# EAGLE board MeshPoint.One (EAGLE 9.1.3), part 1 of 2
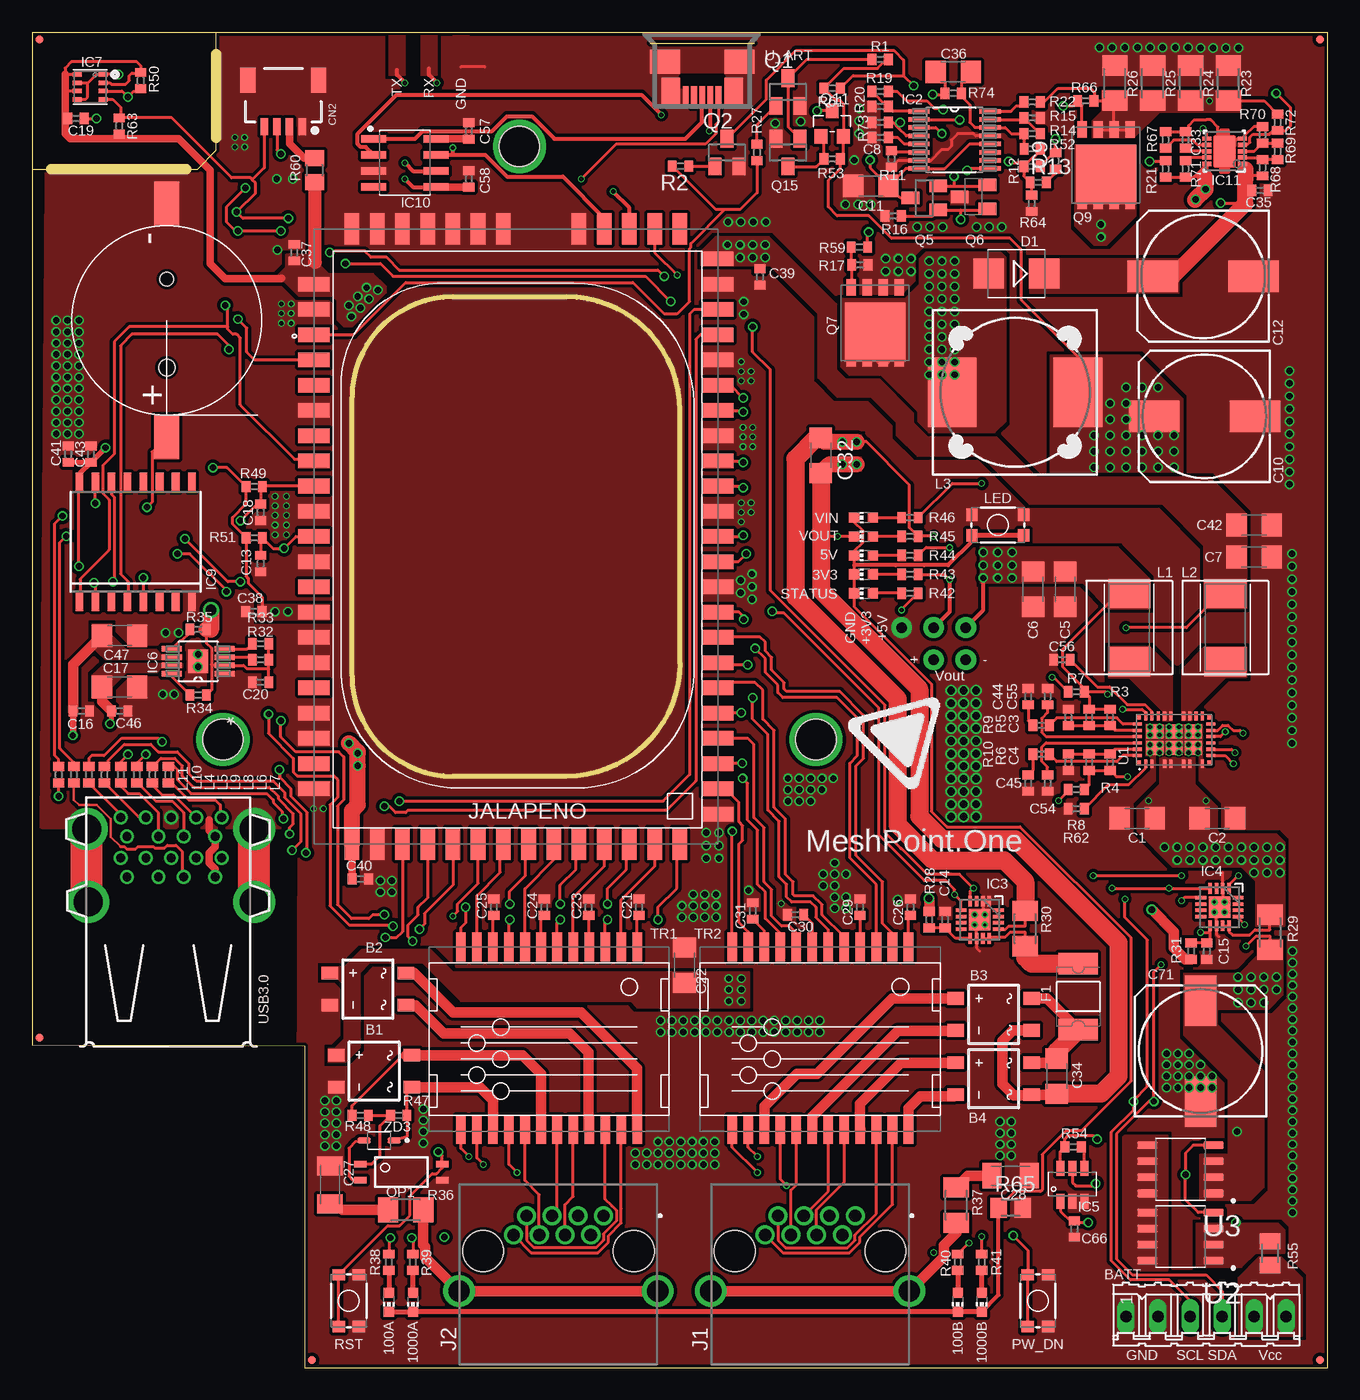
[diagram p10: board, top side]
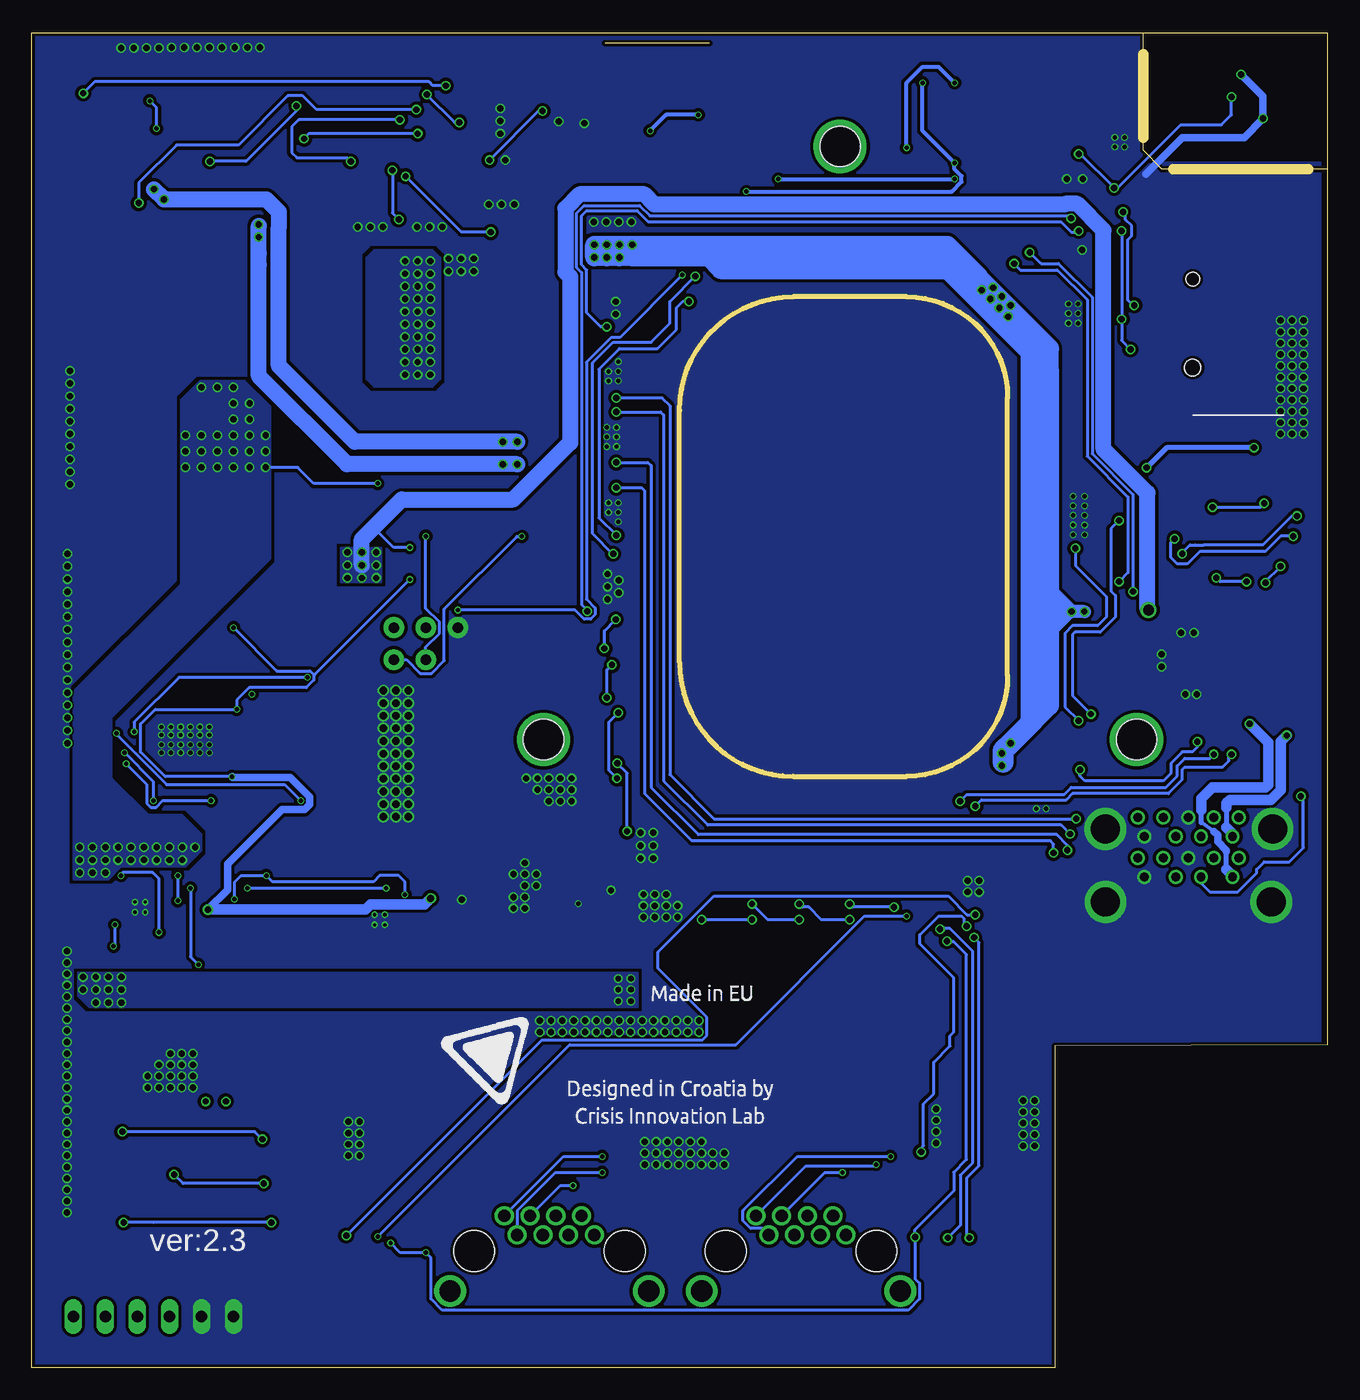
[diagram p11: board, bottom side, seen from below]

Size 102.7 x 105.8 mm. Coordinates in mm from the lower left corner, seen from the top.
Outline: 14.6,105.8 102.7,105.8 102.7,0 21.6,0 21.6,25.5 0,25.6 0,95
Outline: 14.6,105.8 0,105.8 0,95
Outline: 0,95 13.1,95 14.6,96.5 14.6,105.8
Copper layers (1*16): Top 0.035mm / dielectric 1.5mm / Bottom 0.035mm
Design rules "jlcpcb": minimum track width 3.5mil, minimum drill 0.2mm, track to track 5mil, track to pad 5mil, pad to pad 5mil, via to via 5mil, smd to smd 5mil, copper to edge 0.2mm, drill to drill 0.4mm, minimum pad ring 3mil, minimum via ring 3mil, stop-mask expansion 4mil, vias tented up to drill 35mil, thermal gap 10mil
Milling: 2 lines

## Footprints (pad centres in the part's own frame; a part is rotated, then mirrored left to right if it is on the bottom)
CHIP-LED0603 = smd 0.8 x 0.8: A 0,-0.75; C 0,0.75
MBS = smd 1 x 1.3: + -1.27,-3; - 1.27,-3; AC1 -1.27,3; AC2 1.27,3
06P = drill 0.914 long: 1 -6.35,0; 2 -3.81,0; 3 -1.27,0; 4 1.27,0; 5 3.81,0; 6 6.35,0
BATERIJA12MM = smd 3.5 x 2 bottom: + 9.25,0; - -9.25,0 | hole 1.1: -3.276,0 | hole 1.3: 3.744,0
C1206 = smd 1.6 x 1.8: 1 -1.4,0; 2 1.4,0
C0402 = smd 0.7 x 0.9: 1 -0.65,0; 2 0.65,0
153CLV-1010 = smd 4 x 2.5: + 4,0; - -4,0
C1206K = smd 1.5 x 2: 1 -1.5,0; 2 1.5,0
EASYC = smd 0.6 x 1.35: 1 -1.5,2.54; 2 -0.5,2.54; 3 0.5,2.54; 4 1.5,2.54 | smd 1.2 x 2: NC1 2.8,-1.135; NC2 -2.8,-1.135
SMB = smd 2.4 x 2.4: A 2.2,0; C -2.2,0
PTC1812L = smd 1.7 x 3.15: 1 -2.62,0; 2 2.62,0
FIDUCIAL-MICRO = smd 0.635 x 0.635: 1 0,0
PW16 = smd 1.676 x 0.356: 1 -2.819,2.275; 2 -2.819,1.625; 3 -2.819,0.975; 4 -2.819,0.325; 5 -2.819,-0.325; 6 -2.819,-0.975; 7 -2.819,-1.625; 8 -2.819,-2.275; 9 2.819,-2.275; 10 2.819,-1.625; 11 2.819,-0.975; 12 2.819,-0.325; 13 2.819,0.325; 14 2.819,0.975; 15 2.819,1.625; 16 2.819,2.275
RGT16_1P7X1P7 = smd 0.85 x 0.28: 1 -1.475,0.75; 2 -1.475,0.25; 3 -1.475,-0.25; 4 -1.475,-0.75; 9 1.475,-0.75; 10 1.475,-0.25; 11 1.475,0.25; 12 1.475,0.75 | smd 0.28 x 0.85: 5 -0.75,-1.475; 6 -0.25,-1.475; 7 0.25,-1.475; 8 0.75,-1.475; 13 0.75,1.475; 14 0.25,1.475; 15 -0.25,1.475; 16 -0.75,1.475 | smd 1.7 x 1.7: 17 0,0 | drill 0.254 pad 0.508: GND -0.406,0.406; V -0.406,-0.406; V_2 0.406,-0.406; V_3 0.406,0.406
TSOT23 = smd 0.62 x 1.22: 1 -0.9,-1.32; 2 0.05,-1.32; 3 1,-1.32; 4 1,1.3; 5 0.05,1.3; 6 -0.9,1.3
DGN8_1P89X1P57 = smd 1.575 x 0.432: 1 -2.095,0.975; 2 -2.095,0.325; 3 -2.095,-0.325; 4 -2.095,-0.975; 5 2.095,-0.975; 6 2.095,-0.325; 7 2.095,0.325; 8 2.095,0.975 | smd 1.57 x 1.89: EPAD 0,0
BME280 = smd 0.7 x 0.35: 1 1.025,0.975; 2 1.025,0.325; 3 1.025,-0.325; 4 1.025,-0.975; 5 -1.025,-0.975; 6 -1.025,-0.325; 7 -1.025,0.325; 8 -1.025,0.975
SO16DF = smd 0.6 x 1.5: 1 -4.145,-5.09; 2 -2.875,-5.09; 3 -1.605,-5.09; 4 -0.335,-5.09; 5 0.935,-5.09; 6 2.205,-5.09; 7 3.475,-5.09; 8 4.745,-5.09; 9 4.745,4.39; 10 3.475,4.39; 11 2.205,4.39; 12 0.935,4.39; 13 -0.335,4.39; 14 -1.605,4.39; 15 -2.875,4.39; 16 -4.145,4.39
SOIC127P600X175-8 = smd 1.968 x 0.599: 1 -2.473,1.905; 2 -2.473,0.635; 3 -2.473,-0.635; 4 -2.473,-1.905; 5 2.473,-1.905; 6 2.473,-0.635; 7 2.473,0.635; 8 2.473,1.905
DRC0010J = smd 0.7 x 0.35: 1 -1.4,1; 2 -1.4,0.5; 3 -1.4,0; 4 -1.4,-0.5; 5 -1.4,-1; 6 1.4,-1; 7 1.4,-0.5; 8 1.4,0; 9 1.4,0.5; 10 1.4,1 | smd 1.65 x 2.4: 11 0,0 | smd 0.5 x 0.5: V 0,-0.95
SS60300079 = drill 0.97 pad 1.509: 1 0,0; 2 1.02,1.52; 3 -1.02,1.52; 4 -3.06,1.52; 5 -2.04,0; 6 -4.08,0; 7 -6.12,0; 8 -5.1,1.52 | drill 1.68 pad 2.52: MH1 -10.43,-4.45; MH2 5.31,-4.45 | hole 3.25: -8.53,-1.27; 3.41,-1.27
INDC6932X320 = smd 2.312 x 3.312: 1 -2.7,0; 2 2.7,0
DR125 = smd 3.85 x 5.5: 1 -4.975,0; 2 4.975,0
R0402 = smd 0.7 x 0.9: 1 -0.65,0; 2 0.65,0
TACTILE_SWITCH_SMD_4.6X2.8MM = smd 0.9 x 1: 1 -2.05,-0.8; 2 2.05,-0.8; 3 2.05,0.8; 4 -2.05,0.8
MINI-FLAT-4 = smd 1 x 0.5: 1 -3.24,0.635; 2 -3.24,-0.635; 3 3.24,-0.635; 4 3.24,0.635
SOT23 = smd 1 x 1.4: 1 -0.95,-1.1; 2 0.95,-1.1; 3 0,1.1
SOT23-BEC = smd 1 x 1.4: B -0.95,-1.1; C 0,1.1; E 0.95,-1.1
PG-TDSON-8 = smd 1.3 x 0.75: 1 -2.825,1.905; 2 -2.825,0.635; 3 -2.825,-0.635; 4 -2.825,-1.905; 5 2.825,-1.905; 6 2.825,-0.635; 7 2.825,0.635; 8 2.825,1.905 | smd 4.7 x 4.8: TH 0.725,0
SOT-23:1 = smd 1.016 x 1.143: 1 -0.889,-1.016; 2 0.889,-1.016; 3 0,1.016
M1206 = smd 1.6 x 2: 1 -1.4,0; 2 1.4,0
M0805 = smd 1.3 x 1.6: 1 -0.95,0; 2 0.95,0
R0805 = smd 1.3 x 1.5: 1 -0.95,0; 2 0.95,0
WURTH1000T = smd 0.76 x 2.29: 1 -6.35,-6.35; 2 -5.08,-6.35; 3 -3.81,-6.35; 4 -2.54,-6.35; 5 -1.27,-6.35; 6 0,-6.35; 7 1.27,-6.35; 8 2.54,-6.35; 9 3.81,-6.35; 10 5.08,-6.35; 11 6.35,-6.35; 12 7.62,-6.35; 13 7.62,8.13; 14 6.35,8.13; 15 5.08,8.13; 16 3.81,8.13; 17 2.54,8.13; 18 1.27,8.13; 19 0,8.13; 20 -1.27,8.13; 21 -2.54,8.13; 22 -3.81,8.13; 23 -5.08,8.13; 24 -6.35,8.13
QFN50P600X400X103-32N240X440 = smd 0.7 x 0.25: 1 -1.9,2.25; 2 -1.9,1.75; 4 -1.9,0.75; 5 -1.9,0.25; 7 -1.9,-0.75; 8 -1.9,-1.25; 10 -1.9,-2.25; 17 1.9,-2.25; 18 1.9,-1.75; 19 1.9,-1.25; 20 1.9,-0.75; 22 1.9,0.25; 23 1.9,0.75; 24 1.9,1.25; 25 1.9,1.75; 26 1.9,2.25 | smd 0.25 x 0.7: 11 -1.25,-2.9; 12 -0.75,-2.9; 13 -0.25,-2.9; 14 0.25,-2.9; 15 0.75,-2.9; 16 1.25,-2.9; 27 1.25,2.9; 28 0.75,2.9; 29 0.25,2.9; 30 -0.25,2.9; 31 -0.75,2.9; 32 -1.25,2.9 | smd 1.1 x 1.33: 33 -0.65,1.53; 34 0.65,1.53; 35 -0.65,0; 36 0.65,0; 37 -0.65,-1.53; 38 0.65,-1.53 | smd 0.375 x 0.375: P1 -1.812,2.812; P2 1.812,2.812; P3 -1.812,-2.812; P4 1.812,-2.812
SOIC127P490X600X175-8N = smd 1.58 x 0.59: 1 -2.625,1.905; 2 -2.625,0.635; 3 -2.625,-0.635; 4 -2.625,-1.905; 5 2.625,-1.905; 6 2.625,-0.635; 7 2.625,0.635; 8 2.625,1.905
JALAPENO-PCB = smd 1.15 x 2.5: 1 -21.13,-15.24; 2 -19.13,-15.24; 3 -17.13,-15.24; 4 -15.13,-15.24; 5 -13.13,-15.24; 6 -11.13,-15.24; 7 -9.13,-15.24; 8 -7.13,-15.24; 9 -5.13,-15.24; 10 -3.13,-15.24; 11 -1.13,-15.24; 12 0.87,-15.24; 13 2.87,-15.24; 14 4.87,-15.24; 15 6.87,-15.24; 16 8.87,-15.24; 17 10.87,-15.24; 18 12.87,-15.24; 19 14.87,-15.24; 20 16.87,-15.24; 21 18.87,-15.24; 22 20.87,-15.24; 23 22.87,-15.24; 36 20.87,16.76; 37 18.87,16.76; 38 16.87,16.76; 39 14.87,16.76; 40 12.87,16.76; 41 10.87,16.76; 42 8.87,16.76; 43 6.87,16.76; 44 4.87,16.76; 45 2.87,16.76; 46 0.87,16.76; 47 -1.13,16.76; 48 -3.13,16.76; 49 -5.13,16.76; 50 -7.13,16.76; 51 -9.13,16.76; 52 -11.13,16.76; 53 -13.13,16.76; 54 -15.13,16.76; 55 -17.13,16.76; 56 -19.13,16.76 | smd 2.5 x 1.15: 24 25.235,-12.24; 25 25.235,-10.24; 26 25.235,-8.24; 27 25.235,-6.24; 28 25.235,-4.24; 29 25.235,1.76; 30 25.235,3.76; 31 25.235,5.76; 32 25.235,7.76; 33 25.235,9.76; 34 25.235,11.76; 35 25.235,13.76; 57 -23.495,13.76; 58 -23.495,11.76; 59 -23.495,9.76; 60 -23.495,7.76; 61 -23.495,5.76; 62 -23.495,3.76; 63 -23.495,1.76; 64 -23.495,-0.24; 65 -23.495,-2.24; 66 -23.495,-4.24; 67 -23.495,-6.24; 68 -23.495,-8.24; 69 -23.495,-10.24; 70 -23.495,-12.24
HEATSINK = drill 3.2: 1 -23.98,-22.52; 2 23.02,-22.52; 3 -0.48,24.48 | hole 3.2: -0.48,24.48; -23.98,-22.52; 23.02,-22.52
MOLEX-47364-0001 = smd 1.7 x 0.45: 1 2.8,1.3; 2 2.8,0.65; 3 2.8,0; 4 2.8,-0.65; 5 2.8,-1.3 | smd 1.9 x 2.375: GND1 0,2.95; GND4 0,-2.95 | smd 2.1 x 1.475: GND2 2.3,2.5; GND3 2.3,-2.5
USB3.0D = drill 0.7 pad 1.1: 1 -3.59,1.7; 2 -1.09,1.7; 3 0.91,1.7; 4 3.41,1.7; 5 3.91,3.2; 6 1.91,3.2; 7 -0.09,3.2; 8 -2.09,3.2; 9 -4.09,3.2; 10 -3.59,4.9; 11 -1.09,4.9; 12 0.91,4.9; 13 3.41,4.9; 14 3.91,6.4; 15 1.91,6.4; 16 -0.09,6.4; 17 -2.09,6.4; 18 -4.09,6.4 | drill 2.3 pad 2.7: PAD1 -6.66,-0.3; PAD2 6.48,-0.3; PAD3 -6.76,5.5; PAD4 6.49,5.5
SOD2513X120N = smd 1.04 x 0.46: A 1.19,0; C -1.19,0

## Placement (x,y rotation side)
3V3  GR  [CHIP-LED0603]  65.9,62.88 90 top
5V  GR  [CHIP-LED0603]  65.9,64.38 90 top
100A  YL  [CHIP-LED0603]  28.27,5.18 180 top
100B  YL  [CHIP-LED0603]  73.35,5.18 180 top
1000A  GR  [CHIP-LED0603]  30.18,5.18 180 top
1000B  GR  [CHIP-LED0603]  75.26,5.18 180 top
B1  1A/50V  [MBS]  27.1,23.5 270 top
B2  1A/50V  [MBS]  26.6,30 270 top
B3  1A/50V  [MBS]  76.2,28 270 top
B4  1A/50V  [MBS]  76.2,22.9 270 top
BATT  Batt conector  [06P]  93.04,4.04 0 top
BATT1  BATTCR1220  [BATERIJA12MM]  10.67,83 270 bottom
C1  4.7uF  [C1206]  87.58,43.54 0 top
C2  4.7uF  [C1206]  93.93,43.54 0 top
C3  4.7pF  [C0402]  83.77,51.54 90 top
C4  4.7pF  [C0402]  83.77,47.98 90 top
C5  47uF  [C1206]  81.86,61.7 270 top
C6  47uF  [C1206]  79.32,61.7 270 top
C7  47uF  [C1206]  96.85,64.24 180 top
C8  10n/35V  [C0402]  67.2,97.5 180 top
C9  10n/35V  [C0402]  81.1,95.63 90 top
C10  220u/35V  [153CLV-1010]  92.9,75.4 180 top
C11  10u/35V  [C1206]  66.47,93.65 0 top
C12  220u/35V  [153CLV-1010]  92.8,86.5 180 top
C13  100p/35V  [C0402]  18.11,63.73 90 top
C14  1u/35V  [C0402]  72.35,35.5 90 top
C15  1u/35V  [C0402]  93.1,33 270 top
C16  100n/35V  [C0402]  3.89,52.05 0 top
C17  10u/35V  [C1206]  6.93,53.95 180 top
C18  100p/35V  [C0402]  18.11,67.79 270 top
C19  100n/35V  [C0402]  3.47,99 0 top
C20  100n/35V  [C0402]  18.11,54.33 0 top
C21  100n/35V  [C0402]  48.1,36.5 270 top
C22  10u/35V  [C1206]  51.7,31.9 90 top
C23  100n/35V  [C0402]  44.1,36.5 270 top
C24  100n/35V  [C0402]  40.6,36.5 270 top
C25  100n/35V  [C0402]  36.6,36.5 270 top
C26  100n/35V  [C0402]  69.6,36.5 270 top
C27  10n/600V  [C1206K]  23.6,14.5 90 top
C28  10n/600V  [C1206K]  77.55,15.22 0 top
C29  100n/35V  [C0402]  65.6,36.5 270 top
C30  100n/35V  [C0402]  60.5,35.9 0 top
C31  100n/35V  [C0402]  57.1,36.2 270 top
C32  10u/35V  [C1206]  62.5,72.3 270 top
C33  10n/35V  [C0402]  91.4,97.3 270 top
C34  10u/35V  [C1206]  81.2,23.1 270 top
C35  1u/35V  [C0402]  97.3,93.3 180 top
C36  47u/10V  [C1206]  73,102.7 180 top
C37  100n  [C0402]  20.78,88.37 90 top
C38  100n  [C0402]  17.58,59.93 180 top
C39  100n  [C0402]  57.69,86.45 270 top
C40  100n/35V  [C0402]  26.02,38.73 0 top
C41  100n/35V  [C0402]  2.85,72.4 270 top
C42  47uF  [C1206]  96.85,66.78 180 top
C43  100n/35V  [C0402]  4.66,72.4 270 top
C44  220pF  [C0402]  78.94,53.19 270 top
C45  220pF  [C0402]  78.94,46.33 270 top
C46  100n/35V  [C0402]  6.93,52.05 180 top
C47  10u/35V  [C1206]  6.93,58.02 0 top
C54  10nF  [C0402]  80.47,46.33 90 top
C55  10nF  [C0402]  80.47,53.19 90 top
C56  1uF  [C0402]  81.61,56.11 0 top
C57  100n/35V  [C0402]  34.62,98.02 90 top
C58  100n/35V  [C0402]  34.62,94.21 90 top
C66  1u/35V  [C0402]  82.6,11 270 top
C71  220u/35V  [153CLV-1010]  92.6,25.1 90 top
CN2  EASYC  [EASYC]  19.9,100.9 180 top
D1  B140-13-F  [SMB]  78,86.7 180 top
F1  2A  [PTC1812L]  82.9,29.4 270 top
FD1  FIDUCIALUFIDUCIAL  [FIDUCIAL-MICRO]  0.58,26.14 0 top
FD2  FIDUCIALUFIDUCIAL  [FIDUCIAL-MICRO]  0.58,105.26 0 top
FD3  FIDUCIALUFIDUCIAL  [FIDUCIAL-MICRO]  102.06,105.26 0 top
FD4  FIDUCIALUFIDUCIAL  [FIDUCIAL-MICRO]  102.06,0.61 0 top
FD5  FIDUCIALUFIDUCIAL  [FIDUCIAL-MICRO]  22.17,0.61 0 top
IC2  TL494  [PW16]  73.1,97.3 0 top
IC3  INA230_RGT_16  [RGT16_1P7X1P7]  75.1,35.5 270 top
IC4  INA230_RGT_16  [RGT16_1P7X1P7]  94.1,36.5 270 top
IC5  LTC4412  [TSOT23]  82.4,14.5 0 top
IC6  TPS2052B_DGN  [DGN8_1P89X1P57]  13.16,55.98 180 top
IC7  BME280  [BME280]  4.6,101.5 0 top
IC9  PCF2129-16DF  [SO16DF]  7.9,65.8 0 top
IC10  CH330N  [SOIC127P600X175-8]  29.54,95.48 0 top
IC11  TPS26623DRCR  [DRC0010J]  94.5,96.4 180 top
J1  SS-60300-079  [SS60300079]  64.21,10.52 0 top
J2  SS-60300-079  [SS60300079]  44.27,10.52 0 top
L1  PA4333.102NLTPA4333.102NLT  [INDC6932X320]  86.94,58.65 270 top
L2  PA4333.102NLTPA4333.102NLT  [INDC6932X320]  94.56,58.65 270 top
L3  22uH/1A  [DR125]  77.9,77.3 180 top
L4  1nH  [R0402]  4.5,47 90 top
L5  1nH  [R0402]  5.74,47 90 top
L6  1nH  [R0402]  9.54,47 90 top
L7  1nH  [R0402]  10.79,47 90 top
L8  1nH  [R0402]  8.29,47 90 top
L9  1nH  [R0402]  7.04,47 90 top
L10  1nH  [R0402]  3.3,47 270 top
L11  1nH  [R0402]  2.1,47 270 top
LED  MOMENTARY-SWITCH-SPST-SMD-4.6X2.8MM  [TACTILE_SWITCH_SMD_4.6X2.8MM]  76.53,66.78 0 top
OP1  TLP283  [MINI-FLAT-4]  29.27,15.5 0 top
PW_DN  PW_DN  [TACTILE_SWITCH_SMD_4.6X2.8MM]  79.7,5.31 270 top
Q1  BC847  [SOT23]  59.9,101.1 0 top
Q2  BC847  [SOT23]  55.07,96.3 0 top
Q5  BC847  [SOT23]  70.7,92.7 90 top
Q6  BC857  [SOT23-BEC]  74.6,92.8 90 top
Q7  IRFH7932TRPBF  [PG-TDSON-8]  66.8,82.8 270 top
Q9  IRFH7932TRPBF  [PG-TDSON-8]  85.1,95.3 270 top
Q11  SQ2319  [SOT-23:1]  63.4,98.6 0 top
Q15  BC847  [SOT23]  59.9,96.3 180 top
R1  10k  [R0402]  67.2,103.69 180 top
R2  4.7k  [R0402]  51.38,95.23 180 top
R3  1M  [R0402]  85.42,51.54 90 top
R4  1M  [R0402]  85.42,47.98 90 top
R5  191k  [R0402]  82.12,51.54 270 top
R6  316k  [R0402]  82.12,47.98 90 top
R7  100k  [R0402]  82.75,53.57 0 top
R8  100k  [R0402]  82.75,45.82 180 top
R9  15k  [R0402]  79.96,50.9 180 top
R10  15k  [R0402]  79.96,48.62 0 top
R11  3.3k  [R0402]  68.1,95.8 90 top
R12  150k  [R0402]  79.24,95.2 0 top
R13  27K  [R0402]  79.74,93.95 0 top
R14  51K  [R0402]  79.25,97.8 180 top
R15  2K2  [R0402]  79.25,99.05 180 top
R16  1K  [R0402]  68.23,91.28 0 top
R17  10R  [R0402]  65.56,88.8 0 top
R19  8K2  [R0402]  67.2,101.15 180 top
R20  1K  [R0402]  67.2,99.95 180 top
R21  1K  [R0402]  89.82,95 270 top
R22  2K2  [R0402]  79.25,100.3 0 top
R23  1R  [M1206]  94.8,101.8 270 top
R24  1R  [M1206]  91.8,101.8 270 top
R25  1R  [M1206]  88.8,101.8 270 top
R26  1R  [M1206]  85.8,101.8 270 top
R27  4.7k  [R0402]  57.45,96.31 270 top
R28  1R  [R0402]  71.1,35.5 90 top
R29  2mR  [M1206]  98.1,34.5 90 top
R30  2mR  [M1206]  78.7,34.8 270 top
R31  1R  [R0402]  91.85,33 270 top
R32  10K  [R0402]  18.11,56.11 180 top
R33  10K  [R0402]  18.11,57.38 180 top
R34  3.01K  [R0402]  13.16,53.32 180 top
R35  3.01K  [R0402]  13.16,58.52 180 top
R36  75R  [M1206]  29.6,12.5 0 top
R37  75R  [M1206]  73.23,12.88 270 top
R38  330R  [R0402]  28.27,8.36 90 top
R39  330R  [R0402]  30.18,8.36 90 top
R40  330R  [R0402]  73.35,8.36 90 top
R41  330R  [R0402]  75.26,8.36 90 top
R42  470R  [R0402]  69.57,61.38 0 top
R43  330R  [R0402]  69.57,62.88 0 top
R44  470R  [R0402]  69.57,64.38 0 top
R45  10k  [R0402]  69.57,65.88 0 top
R46  2K2  [R0402]  69.57,67.38 0 top
R47  470R  [R0402]  29.05,20 180 top
R48  2K2  [R0402]  26,20 0 top
R49  4K7  [R0402]  17.6,69.83 0 top
R50  10K  [R0402]  8.6,102 90 top
R51  4K7  [R0402]  17.6,65.76 180 top
R52  51k  [R0402]  79.26,96.6 180 top
R53  10k  [R0402]  63.4,95.8 180 top
R54  470K  [R0402]  82.5,17.5 180 top
R55  0  [M0805]  98.1,9.07 90 top
R59  10k  [R0402]  65.6,87.4 0 top
R60  0R  [R0805]  22.38,94.91 270 top
R61  10K  [R0402]  63.4,101.4 0 top
R62  15k  [R0402]  82.75,44.3 180 top
R63  10K  [R0402]  6.9,98.4 270 top
R64  51k  [R0402]  79.2,92.28 90 top
R65  0  [M0805]  77.55,12.68 0 top
R66  10K  [R0402]  83.5,100.4 180 top
R67  13k3  [R0402]  89.82,97.3 270 top
R68  715k  [R0402]  97.5,95.1 270 top
R69  20k  [R0402]  98.7,96.4 270 top
R70  30k1  [R0402]  97.5,97.7 270 top
R71  100k  [R0402]  91.4,95 270 top
R72  100k  [R0402]  98.7,98.7 270 top
R73  10k  [R0402]  67.2,98.7 0 top
R74  470k  [R0402]  73,101 0 top
RST  RST  [TACTILE_SWITCH_SMD_4.6X2.8MM]  25.1,5.31 270 top
STATUS  BL  [CHIP-LED0603]  65.9,61.38 90 top
TR1  WURTH_TR  [WURTH1000T]  41.6,27 180 top
TR2  WURTH_TR  [WURTH1000T]  63.1,27 180 top
U1  LT8650SEV#PBF  [QFN50P600X400X103-32N240X440]  90.5,49.76 90 top
U2  SI4435DYTRPBF  [SOIC127P490X600X175-8N]  91.01,10.39 180 top
U3  SI4435DYTRPBF  [SOIC127P490X600X175-8N]  91.01,15.72 180 top
U$5  JALAPENO  [JALAPENO-PCB]  39.1,65 90 top
U$9  HEATSINK  [HEATSINK]  39.1,72.3 0 top
U_ART  MOLEX-47346-0001  [MOLEX-47364-0001]  53.1,103.5 270 top
USB3.0  USB3.0D  [USB3.0D]  11.1,37.2 0 top
VIN  GR  [CHIP-LED0603]  65.9,67.38 90 top
VOUT  BL  [CHIP-LED0603]  65.9,65.88 90 top
ZD3  BZT52C15S  [SOD2513X120N]  27.5,18 180 top